# EAGLE schematic EURO RACK REV 3 (EAGLE 6.6.0)
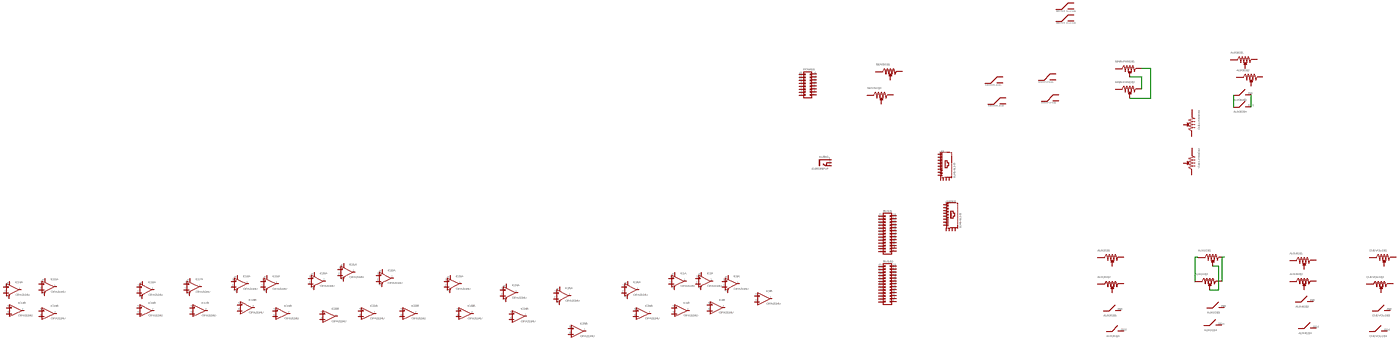
[diagram p0: schematic, sheet 1, overview]
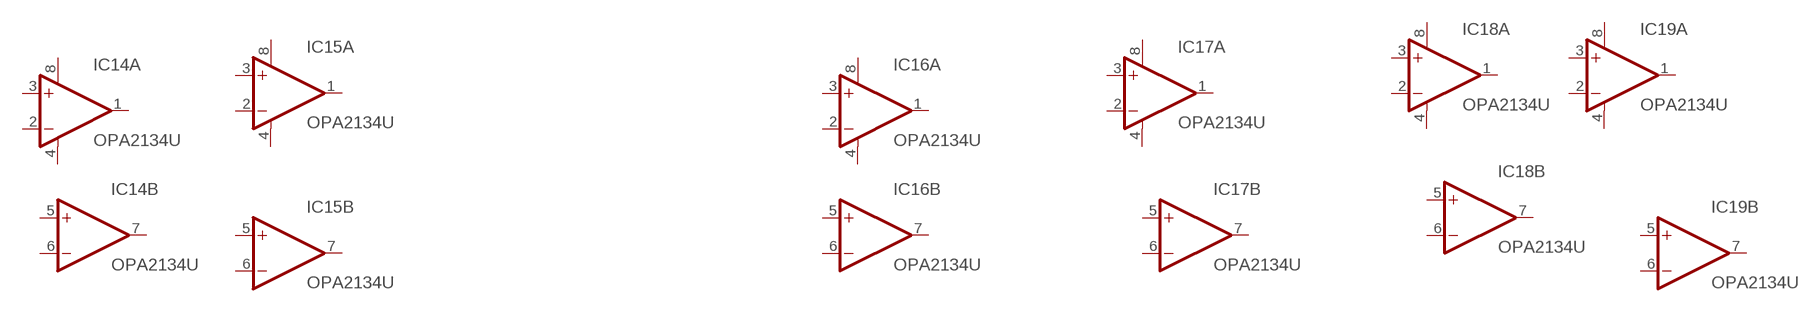
[diagram p1: schematic, sheet 1, part 1 of 4]
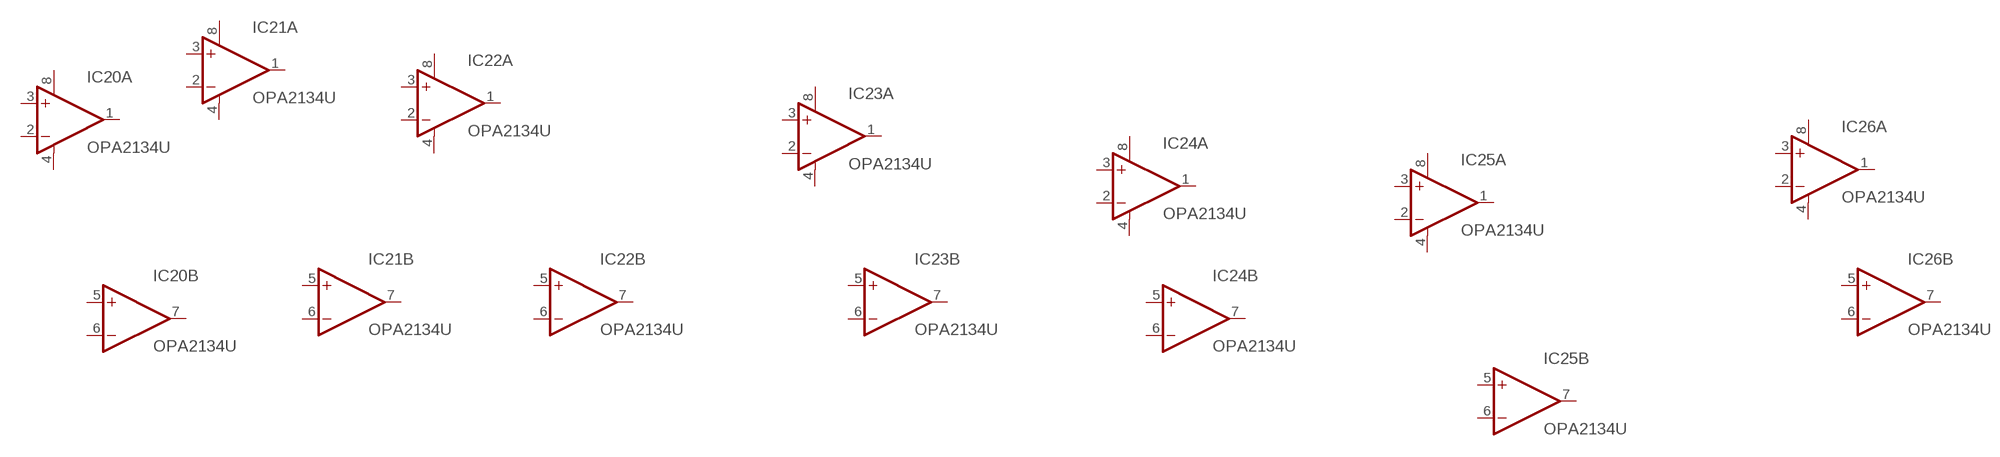
[diagram p2: schematic, sheet 1, part 2 of 4]
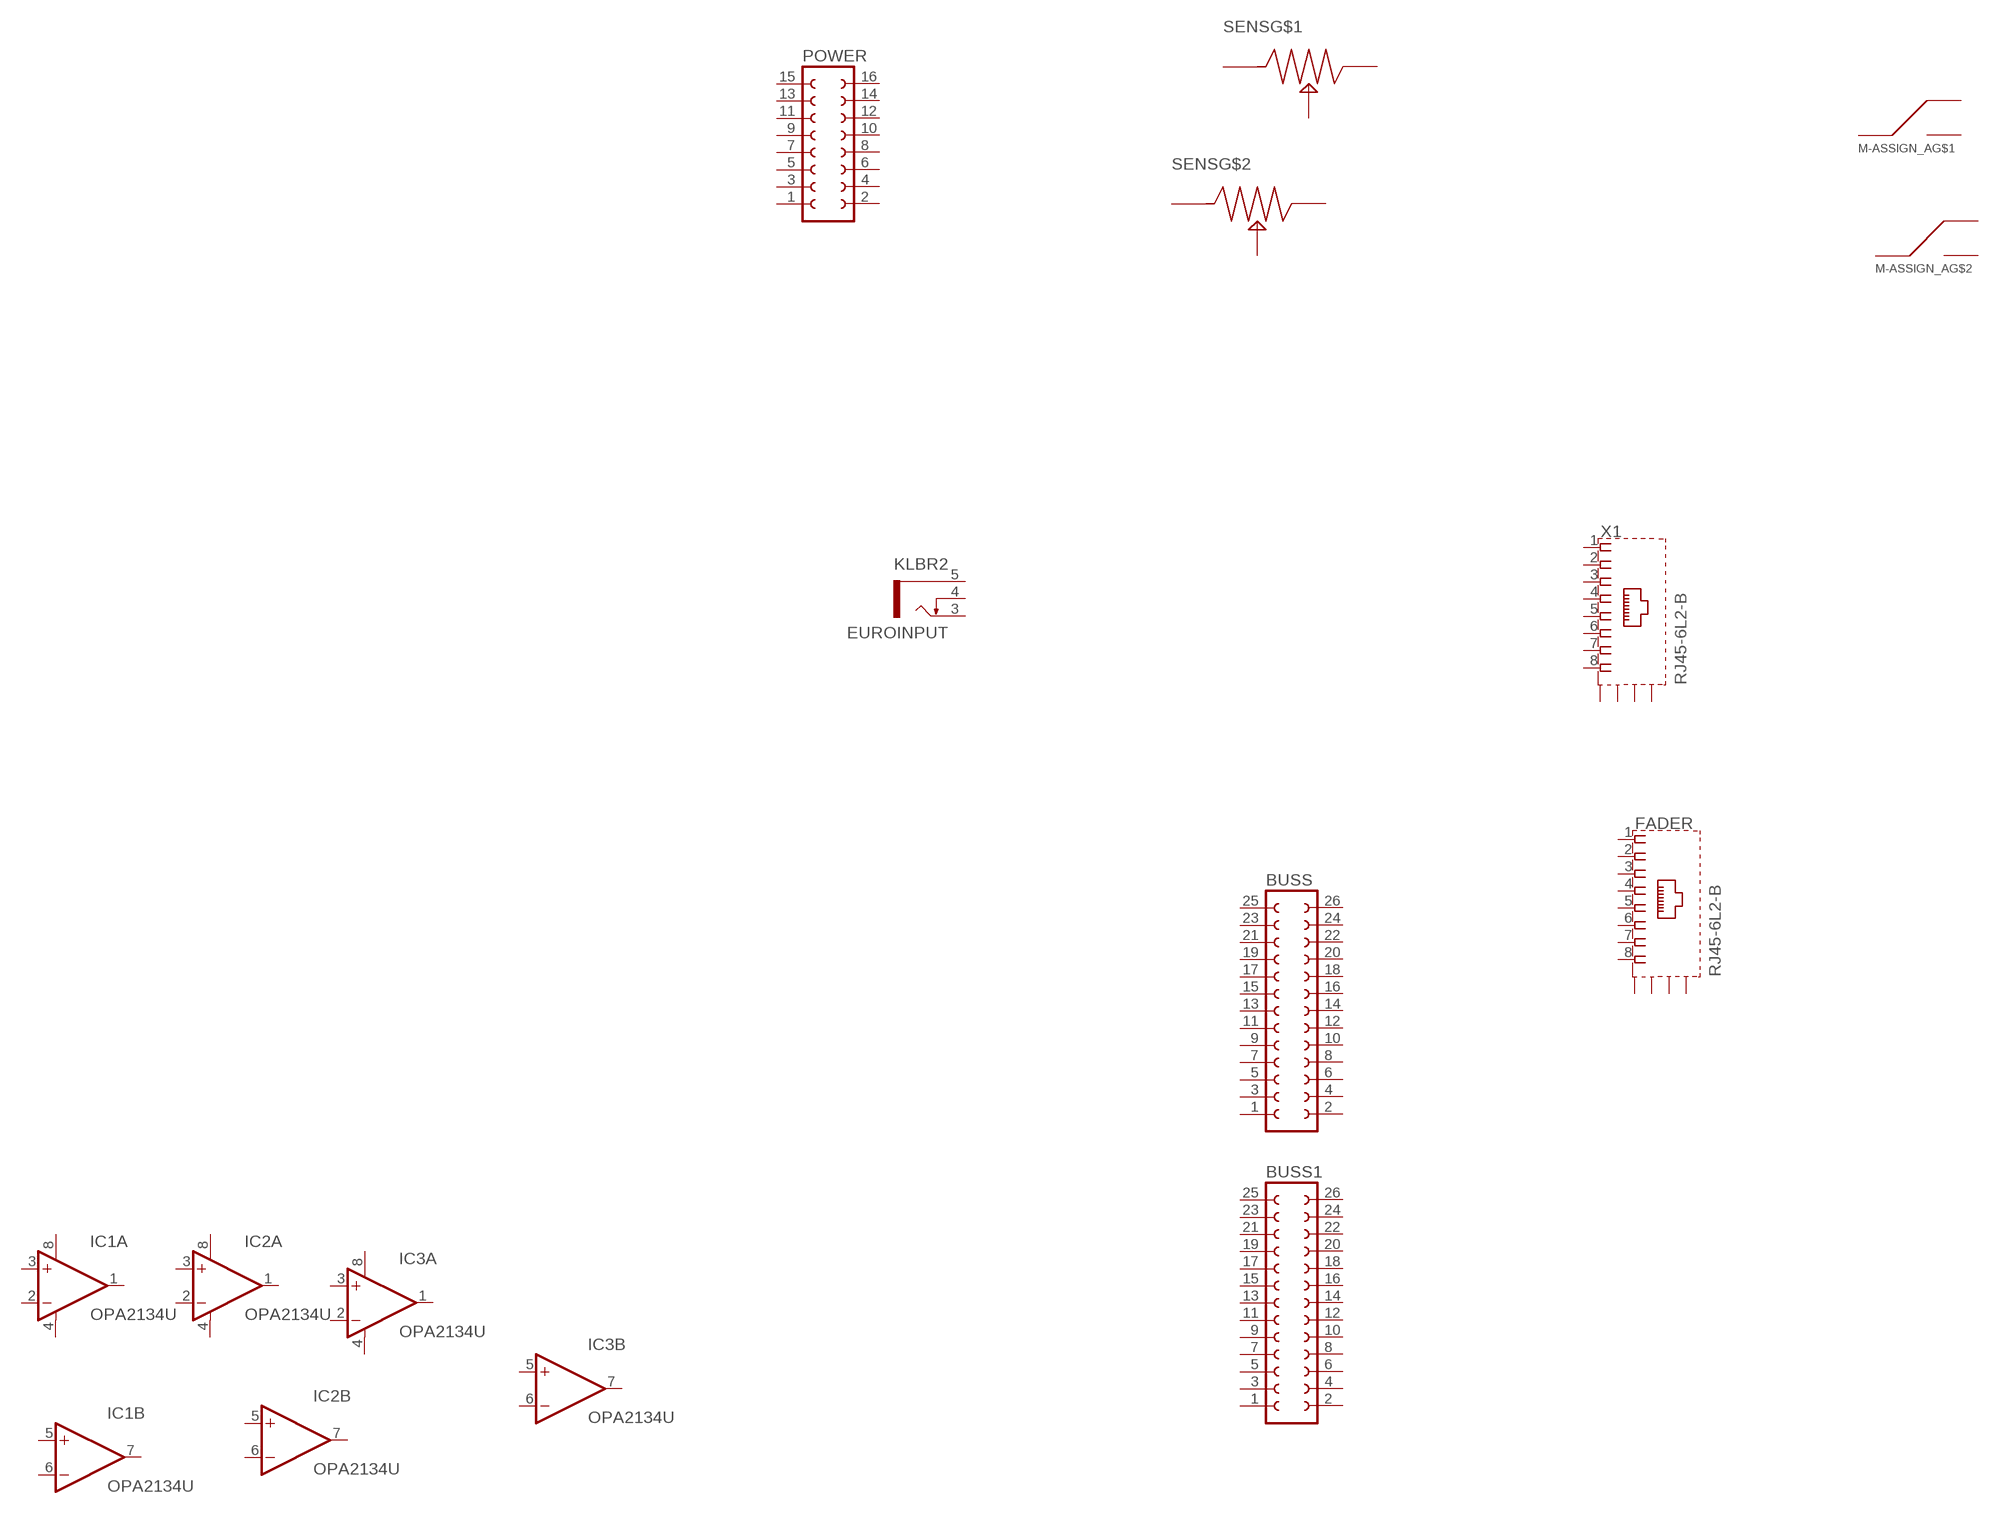
[diagram p3: schematic, sheet 1, part 3 of 4]
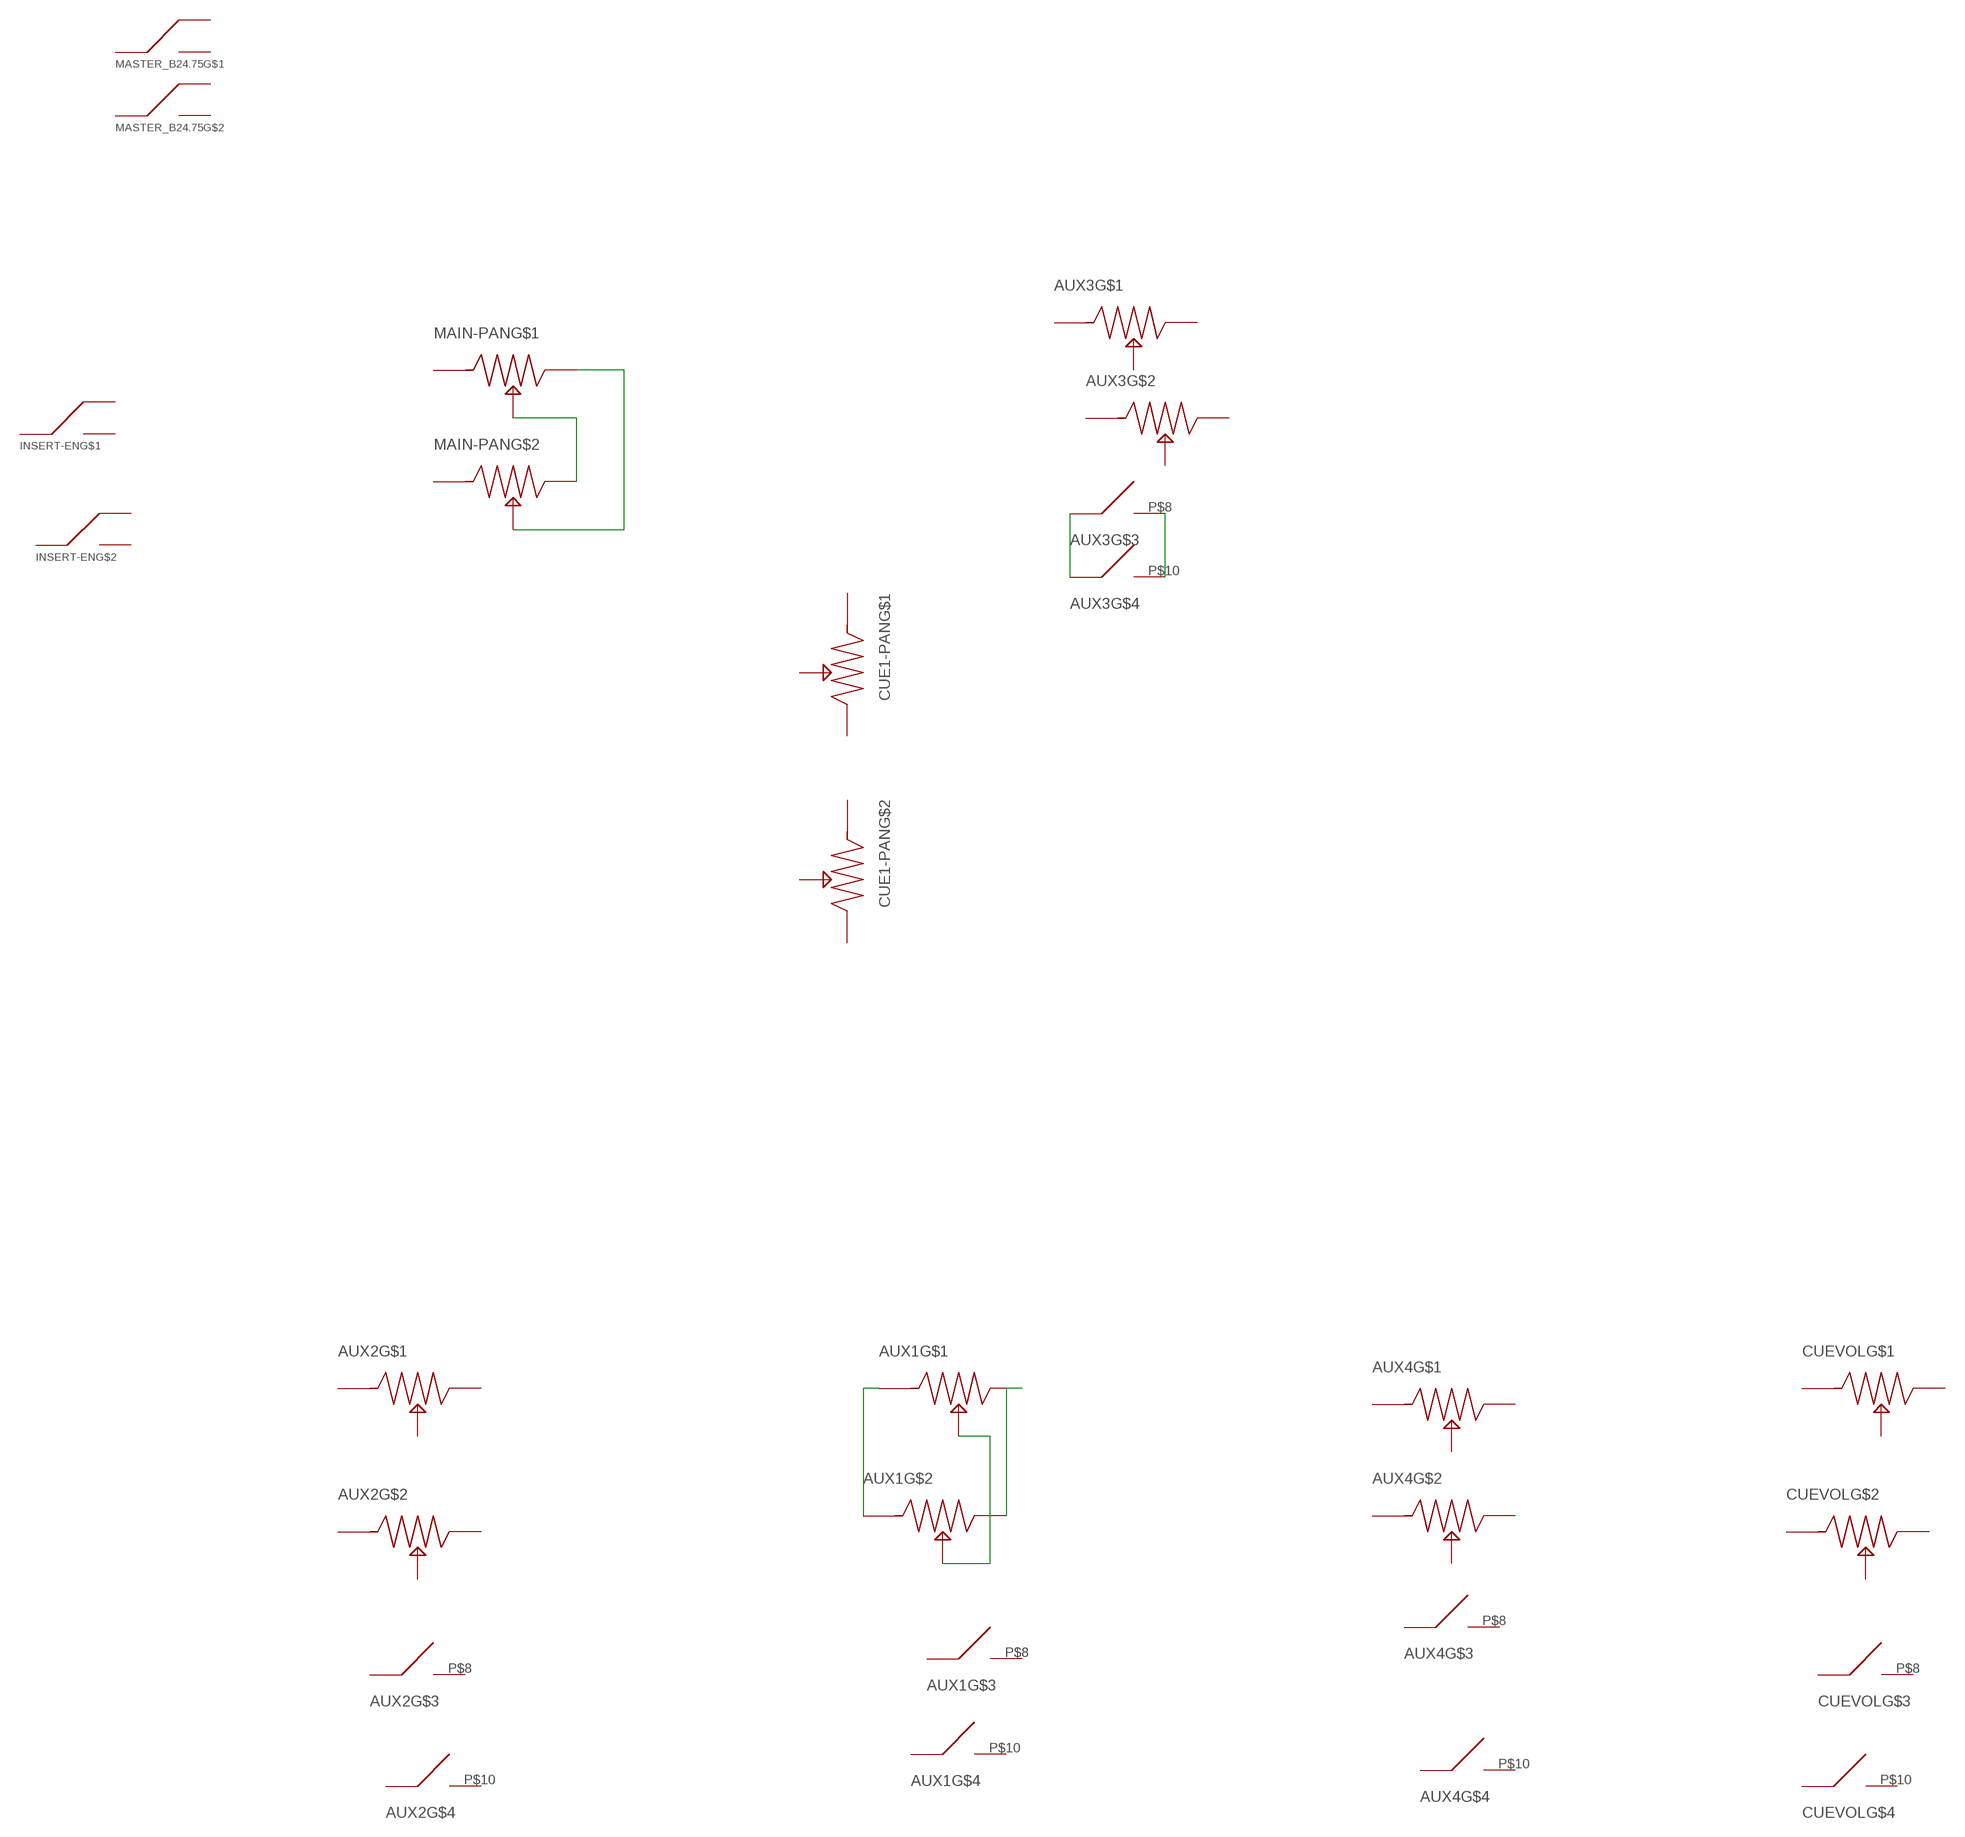
[diagram p4: schematic, sheet 1, part 4 of 4]

## Parts
AUX1  WBS_10-081_DUALPOT+DUALSWITCH  [WBS_10-081]
AUX2  WBS_10-081_DUALPOT+DUALSWITCH  [WBS_10-081]
AUX3  WBS_10-081_DUALPOT+DUALSWITCH  [WBS_10-081]
AUX4  WBS_10-081_DUALPOT+DUALSWITCH  [WBS_10-081]
BUSS  FE13-2  [FE13-2]
BUSS1  FE13-2  [FE13-2]
CUE1-PAN  WBS_10-079_POT  [WBS_079]
CUEVOL  WBS_10-081_DUALPOT+DUALSWITCH  [WBS_10-081]
EUROINPUT  KLBR2  [KLBR2]
FADER  RJ45-6L2-B  [RJ45-SHIELD2]
IC1  OPA2134U  [SO08]
IC2  OPA2134U  [SO08]
IC3  OPA2134U  [SO08]
IC14  OPA2134U  [SO08]
IC15  OPA2134U  [SO08]
IC16  OPA2134U  [SO08]
IC17  OPA2134U  [SO08]
IC18  OPA2134U  [SO08]
IC19  OPA2134U  [SO08]
IC20  OPA2134U  [SO08]
IC21  OPA2134U  [SO08]
IC22  OPA2134U  [SO08]
IC23  OPA2134U  [SO08]
IC24  OPA2134U  [SO08]
IC25  OPA2134U  [SO08]
IC26  OPA2134U  [SO08]
INSERT-EN  WBS_DPDT  [WBS_DPDT_SWITCH]
M-ASSIGN_A  WBS_DPDT  [WBS_DPDT_SWITCH]
MAIN-PAN  WBS_10-079_POT  [WBS_079]
MASTER_B24.75  WBS_DPDT  [WBS_DPDT_SWITCH]
POWER  FE08-2  [FE08-2]
SENS  WBS_10-079_POT  [WBS_079]
X1  RJ45-6L2-B  [RJ45-SHIELD2]

## Nets
N$1: MAIN-PAN.P$3(CW) MAIN-PAN.P$5(WIPER)
N$2: MAIN-PAN.P$2(WIPER) MAIN-PAN.P$6(CW)
N$3: AUX3.P$7 AUX3.P$9
N$4: AUX3.P$8 AUX3.P$10
N$5: AUX1.P$3(CW) AUX1.P$6(CW)
N$6: AUX1.P$1(CCW) AUX1.P$4(CCW)
N$7: AUX1.P$2(WIPER) AUX1.P$5(WIPER)
Unconnected: AUX1.P$7 AUX1.P$8 AUX1.P$9 AUX1.P$10 AUX2.P$1(CCW) AUX2.P$2(WIPER) AUX2.P$3(CW) AUX2.P$4(CCW) AUX2.P$5(WIPER) AUX2.P$6(CW) AUX2.P$7 AUX2.P$8 AUX2.P$9 AUX2.P$10 AUX3.P$1(CCW) AUX3.P$2(WIPER) AUX3.P$3(CW) AUX3.P$4(CCW) AUX3.P$5(WIPER) AUX3.P$6(CW) AUX4.P$1(CCW) AUX4.P$2(WIPER) AUX4.P$3(CW) AUX4.P$4(CCW) AUX4.P$5(WIPER) AUX4.P$6(CW) AUX4.P$7 AUX4.P$8 AUX4.P$9 AUX4.P$10 BUSS1.1 BUSS1.2 BUSS1.3 BUSS1.4 BUSS1.5 BUSS1.6 BUSS1.7 BUSS1.8 BUSS1.9 BUSS1.10 BUSS1.11 BUSS1.12 BUSS1.13 BUSS1.14 BUSS1.15 BUSS1.16 BUSS1.17 BUSS1.18 BUSS1.19 BUSS1.20 BUSS1.21 BUSS1.22 BUSS1.23 BUSS1.24 BUSS1.25 BUSS1.26 BUSS.1 BUSS.2 BUSS.3 BUSS.4 BUSS.5 BUSS.6 BUSS.7 BUSS.8 BUSS.9 BUSS.10 BUSS.11 BUSS.12 BUSS.13 BUSS.14 BUSS.15 BUSS.16 BUSS.17 BUSS.18 BUSS.19 BUSS.20 BUSS.21 BUSS.22 BUSS.23 BUSS.24 BUSS.25 BUSS.26 CUE1-PAN.P$1(CCW) CUE1-PAN.P$2(WIPER) CUE1-PAN.P$3(CW) CUE1-PAN.P$4(CCW) CUE1-PAN.P$5(WIPER) CUE1-PAN.P$6(CW) CUEVOL.P$1(CCW) CUEVOL.P$2(WIPER) CUEVOL.P$3(CW) CUEVOL.P$4(CCW) CUEVOL.P$5(WIPER) CUEVOL.P$6(CW) CUEVOL.P$7 CUEVOL.P$8 CUEVOL.P$9 CUEVOL.P$10 EUROINPUT.3 EUROINPUT.4 EUROINPUT.5 FADER.1 FADER.2 FADER.3 FADER.4 FADER.5 FADER.6 FADER.7 FADER.8 FADER.S1(S) FADER.S2(S) FADER.S3(S) FADER.S4(S) IC1.1(A:OUT) IC1.2(A:-IN) IC1.3(A:+IN) IC1.5(B:+IN) IC1.6(B:-IN) IC1.7(B:OUT) IC2.1(A:OUT) IC2.2(A:-IN) IC2.3(A:+IN) IC2.5(B:+IN) IC2.6(B:-IN) IC2.7(B:OUT) IC3.1(A:OUT) IC3.2(A:-IN) IC3.3(A:+IN) IC3.5(B:+IN) IC3.6(B:-IN) IC3.7(B:OUT) IC14.1(A:OUT) IC14.2(A:-IN) IC14.3(A:+IN) IC14.5(B:+IN) IC14.6(B:-IN) IC14.7(B:OUT) IC15.1(A:OUT) IC15.2(A:-IN) IC15.3(A:+IN) IC15.5(B:+IN) IC15.6(B:-IN) IC15.7(B:OUT) IC16.1(A:OUT) IC16.2(A:-IN) IC16.3(A:+IN) IC16.5(B:+IN) IC16.6(B:-IN) IC16.7(B:OUT) IC17.1(A:OUT) IC17.2(A:-IN) IC17.3(A:+IN) IC17.5(B:+IN) IC17.6(B:-IN) IC17.7(B:OUT) IC18.1(A:OUT) IC18.2(A:-IN) IC18.3(A:+IN) IC18.5(B:+IN) IC18.6(B:-IN) IC18.7(B:OUT) IC19.1(A:OUT) IC19.2(A:-IN) IC19.3(A:+IN) IC19.5(B:+IN) IC19.6(B:-IN) IC19.7(B:OUT) IC20.1(A:OUT) IC20.2(A:-IN) IC20.3(A:+IN) IC20.5(B:+IN) IC20.6(B:-IN) IC20.7(B:OUT) IC21.1(A:OUT) IC21.2(A:-IN) IC21.3(A:+IN) IC21.5(B:+IN) IC21.6(B:-IN) IC21.7(B:OUT) IC22.1(A:OUT) IC22.2(A:-IN) IC22.3(A:+IN) IC22.5(B:+IN) IC22.6(B:-IN) IC22.7(B:OUT) IC23.1(A:OUT) IC23.2(A:-IN) IC23.3(A:+IN) IC23.5(B:+IN) IC23.6(B:-IN) IC23.7(B:OUT) IC24.1(A:OUT) IC24.2(A:-IN) IC24.3(A:+IN) IC24.5(B:+IN) IC24.6(B:-IN) IC24.7(B:OUT) IC25.1(A:OUT) IC25.2(A:-IN) IC25.3(A:+IN) IC25.5(B:+IN) IC25.6(B:-IN) IC25.7(B:OUT) IC26.1(A:OUT) IC26.2(A:-IN) IC26.3(A:+IN) IC26.5(B:+IN) IC26.6(B:-IN) IC26.7(B:OUT) INSERT-EN.P$1(O) INSERT-EN.P$2(W) INSERT-EN.P$3(C) INSERT-EN.P$4(O) INSERT-EN.P$5(W) INSERT-EN.P$6(C) M-ASSIGN_A.P$1(O) M-ASSIGN_A.P$2(W) M-ASSIGN_A.P$3(C) M-ASSIGN_A.P$4(O) M-ASSIGN_A.P$5(W) M-ASSIGN_A.P$6(C) MAIN-PAN.P$1(CCW) MAIN-PAN.P$4(CCW) MASTER_B24.75.P$1(O) MASTER_B24.75.P$2(W) MASTER_B24.75.P$3(C) MASTER_B24.75.P$4(O) MASTER_B24.75.P$5(W) MASTER_B24.75.P$6(C) POWER.1 POWER.2 POWER.3 POWER.4 POWER.5 POWER.6 POWER.7 POWER.8 POWER.9 POWER.10 POWER.11 POWER.12 POWER.13 POWER.14 POWER.15 POWER.16 SENS.P$1(CCW) SENS.P$2(WIPER) SENS.P$3(CW) SENS.P$4(CCW) SENS.P$5(WIPER) SENS.P$6(CW) X1.1 X1.2 X1.3 X1.4 X1.5 X1.6 X1.7 X1.8 X1.S1(S) X1.S2(S) X1.S3(S) X1.S4(S)

## Power pins joined to a net without a drawn wire
V+: IC1.8(A:V+) IC2.8(A:V+) IC3.8(A:V+) IC14.8(A:V+) IC15.8(A:V+) IC16.8(A:V+) IC17.8(A:V+) IC18.8(A:V+) IC19.8(A:V+) IC20.8(A:V+) IC21.8(A:V+) IC22.8(A:V+) IC23.8(A:V+) IC24.8(A:V+) IC25.8(A:V+) IC26.8(A:V+)
V-: IC1.4(A:V-) IC2.4(A:V-) IC3.4(A:V-) IC14.4(A:V-) IC15.4(A:V-) IC16.4(A:V-) IC17.4(A:V-) IC18.4(A:V-) IC19.4(A:V-) IC20.4(A:V-) IC21.4(A:V-) IC22.4(A:V-) IC23.4(A:V-) IC24.4(A:V-) IC25.4(A:V-) IC26.4(A:V-)

## Library data of the parts
AUX1-AUX4 CUEVOL = APK - PARTS:WBS_10-081_DUALPOT+DUALSWITCH
BUSS BUSS1 = con-lsta:FE13-2: FEMALE HEADER; OC_FARNELL: unknown; OC_NEWARK: unknown
CUE1-PAN MAIN-PAN SENS = APK - PARTS:WBS_10-079_POT
EUROINPUT = con-lumberg:KLBR?: Jack connectors according to JISC 6560, 2.5mm / 3.5 mm Klinkensteckverbinder nach JISC 6560, 2.5mm / 3,5 mm Source: http://www.lumberg.com/Produkte/PDFs/KLBR2.pdf www.lumberg.com/Produkte/PDFs/KLBR1.pdf; OC_FARNELL: unknown; OC_NEWARK: unknown
FADER X1 = con-tycoelectronics:RJ45*2: RJ45 Low Profile Shield Type 2 For all RJ45 L, LC, LCT and X Series Models Source: www.tycoelectronics.com .. ENG_DS_1654001_1099_RJ_L_0507.pdf; MPN: RJ45-6L2-B; OC_FARNELL: unknown; OC_NEWARK: 16R6096
IC1-IC3 IC14-IC26 = burr-brown:OPA2134: Operational Amplifier; MF: TEXAS INSTRUMENTS; MPN: OPA2134UA; OC_FARNELL: 1206935; OC_NEWARK: 35C1847
INSERT-EN M-ASSIGN_A MASTER_B24.75 = APK - PARTS:WBS_DPDT
POWER = con-lsta:FE08-2: FEMALE HEADER; OC_FARNELL: unknown; OC_NEWARK: unknown